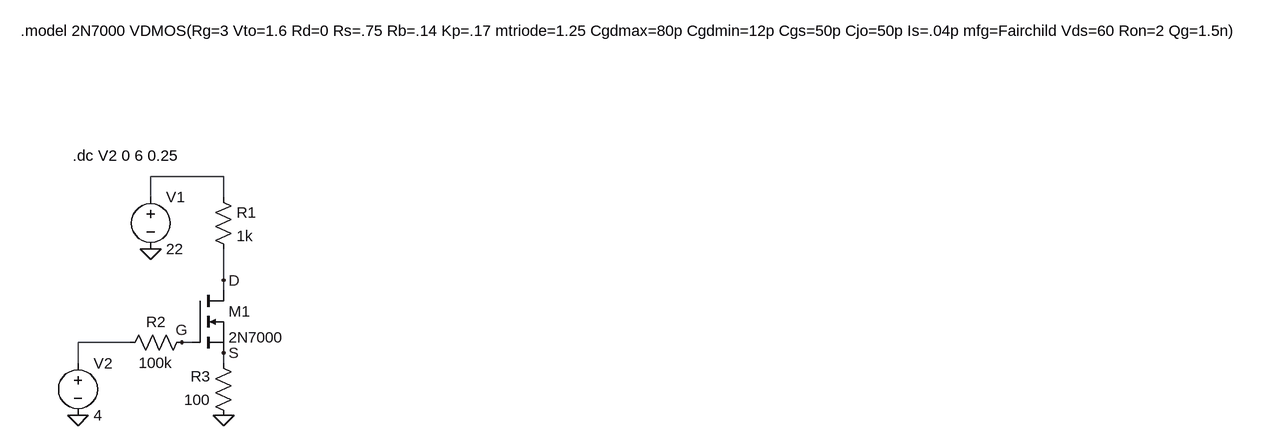
[diagram p0: schematic part1.asc]
part1.asc, the LTspice schematic file:
Version 4
SHEET 1 1948 680
WIRE 192 96 80 96
WIRE 80 128 80 96
WIRE 192 128 192 96
WIRE 192 256 192 208
WIRE 192 272 192 256
WIRE 48 352 -32 352
WIRE 144 352 128 352
WIRE -32 384 -32 352
WIRE 192 384 192 368
FLAG -32 464 0
FLAG 192 464 0
FLAG 80 208 0
FLAG 192 256 D
FLAG 192 368 S
FLAG 128 352 G
SYMBOL res 176 112 R0
SYMATTR InstName R1
SYMATTR Value 1k
SYMBOL res 144 336 R90
WINDOW 0 0 56 VBottom 2
WINDOW 3 32 56 VTop 2
SYMATTR InstName R2
SYMATTR Value 100k
SYMBOL res 208 480 R180
WINDOW 0 36 76 Left 2
WINDOW 3 36 40 Left 2
SYMATTR InstName R3
SYMATTR Value 100
SYMBOL voltage 80 112 R0
SYMATTR InstName V1
SYMATTR Value 22
SYMBOL voltage -32 368 R0
SYMATTR InstName V2
SYMATTR Value 4
SYMBOL nmos 144 272 R0
SYMATTR InstName M1
SYMATTR Value 2N7000
TEXT -120 -128 Left 2 !.model 2N7000 VDMOS(Rg=3 Vto=1.6 Rd=0 Rs=.75 Rb=.14 Kp=.17 mtriode=1.25 Cgdmax=80p Cgdmin=12p Cgs=50p Cjo=50p Is=.04p mfg=Fairchild Vds=60 Ron=2 Qg=1.5n)
TEXT -40 64 Left 2 !.dc V2 0 6 0.25

The netlist it stands for:
* part1.asc
R1 N001 D 1k
R2 G N002 100k
R3 0 S 100
V1 N001 0 22
V2 N002 0 4
M1 D G S S 2N7000
.model NMOS NMOS
.model PMOS PMOS
.lib standard.mos
.model 2N7000 VDMOS(Rg=3 Vto=1.6 Rd=0 Rs=.75 Rb=.14 Kp=.17 mtriode=1.25 Cgdmax=80p Cgdmin=12p Cgs=50p Cjo=50p Is=.04p mfg=Fairchild Vds=60 Ron=2 Qg=1.5n)
.dc V2 0 6 0.25
.backanno
.end

* Results of the author's LTspice run, read from the files saved beside the schematic
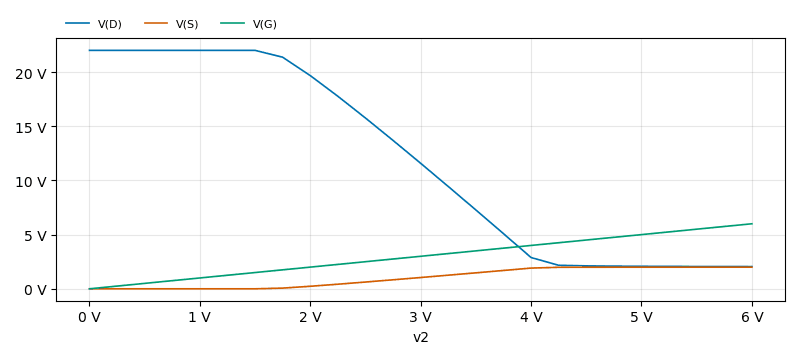
[diagram p1: DC transfer characteristic of part1.asc, plotted from the saved traces]
* DC transfer characteristic, 1 run:
*   V(D): 22 V at v2=0 V, 2.05 V at v2=6 V, min 2.05 V, max 22 V
*   V(S): 4.404 nV at v2=0 V, 1.995 V at v2=6 V, min 4.404 nV, max 1.995 V
*   V(G): 0 V at v2=0 V, 6 V at v2=6 V, min 0 V, max 6 V